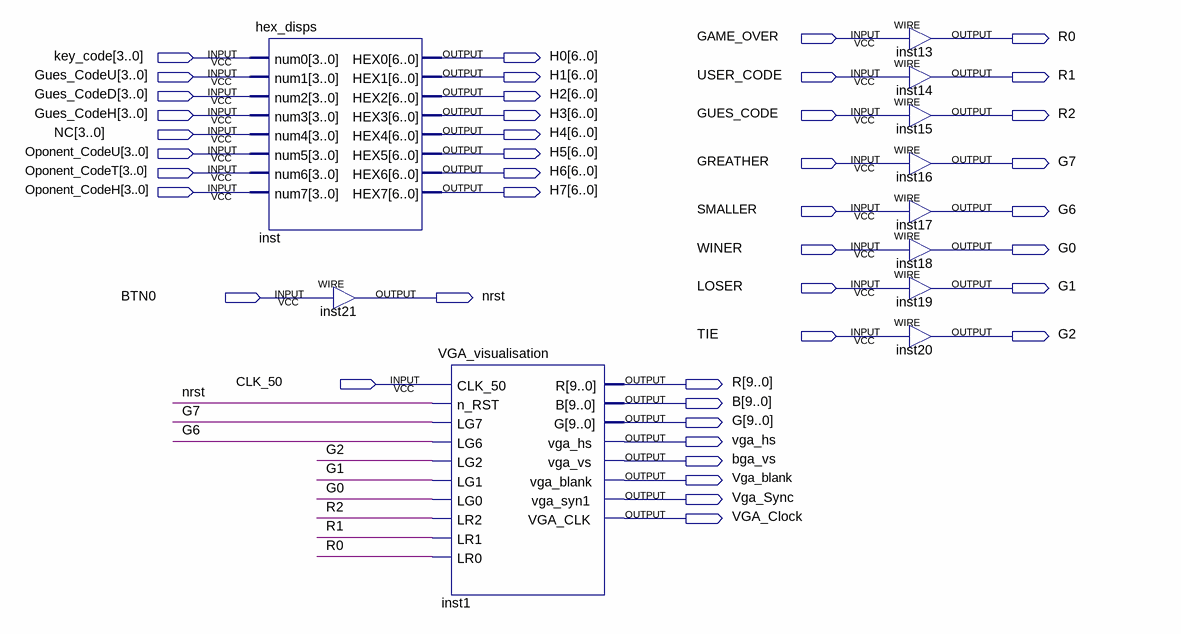
[diagram p0: schematic sheet]
// Quartus schematic I_O_Manager_VGA.bdf as structural Verilog: 11 symbols, 43 pins
module I_O_Manager_VGA (
  input  GAME_OVER,
  input  [3:0] key_code,
  input  [3:0] Gues_CodeU,
  input  USER_CODE,
  input  [3:0] Gues_CodeD,
  input  [3:0] Gues_CodeH,
  input  GUES_CODE,
  input  [3:0] NC,
  input  [3:0] Oponent_CodeU,
  input  GREATHER,
  input  [3:0] Oponent_CodeT,
  input  [3:0] Oponent_CodeH,
  input  SMALLER,
  input  WINER,
  input  LOSER,
  input  BTN0,
  input  TIE,
  input  CLK_50,
  output R0,
  output [6:0] H0,
  output [6:0] H1,
  output R1,
  output [6:0] H2,
  output [6:0] H3,
  output R2,
  output [6:0] H4,
  output [6:0] H5,
  output G7,
  output [6:0] H6,
  output [6:0] H7,
  output G6,
  output G0,
  output G1,
  output nrst,
  output G2,
  output [9:0] R,
  output [9:0] B,
  output [9:0] G,
  output vga_hs,
  output bga_vs,
  output Vga_blank,
  output Vga_Sync,
  output VGA_Clock
);

  hex_disps inst (
    .num0(key_code), .num1(Gues_CodeU), .num2(Gues_CodeD), .num3(Gues_CodeH), .num4(NC),
    .num5(Oponent_CodeU), .num6(Oponent_CodeT), .num7(Oponent_CodeH), .HEX0(H0), .HEX1(H1), .HEX2(H2),
    .HEX3(H3), .HEX4(H4), .HEX5(H5), .HEX6(H6), .HEX7(H7));
  assign nrst = BTN0;  // WIRE inst21
  VGA_visualisation inst1 (
    .CLK_50(CLK_50), .n_RST(nrst), .LG7(G[7]), .LG6(G[6]), .LG2(G[2]), .LG1(G[1]), .LG0(G[0]), .LR2(R[2]),
    .LR1(R[1]), .LR0(R[0]), .R(R), .B(B), .G(G), .vga_hs(vga_hs), .vga_vs(bga_vs), .vga_blank(Vga_blank),
    .vga_syn1(Vga_Sync), .VGA_CLK(VGA_Clock));
  assign R[0] = GAME_OVER;  // WIRE inst13
  assign R[1] = USER_CODE;  // WIRE inst14
  assign R[2] = GUES_CODE;  // WIRE inst15
  assign G[7] = GREATHER;  // WIRE inst16
  assign G[6] = SMALLER;  // WIRE inst17
  assign G[0] = WINER;  // WIRE inst18
  assign G[1] = LOSER;  // WIRE inst19
  assign G[2] = TIE;  // WIRE inst20

  assign G0 = G[0];
  assign G1 = G[1];
  assign G2 = G[2];
  assign G6 = G[6];
  assign G7 = G[7];
  assign R0 = R[0];
  assign R1 = R[1];
  assign R2 = R[2];
endmodule
